# Altium project Phaser.PrjPCB (part 4 of 11)

## Sheet FPGA.SchDoc: =DocumentName
size A4; DocumentNumber: 1; Revision: 0; SheetNumber: 15; SheetTotal: 30
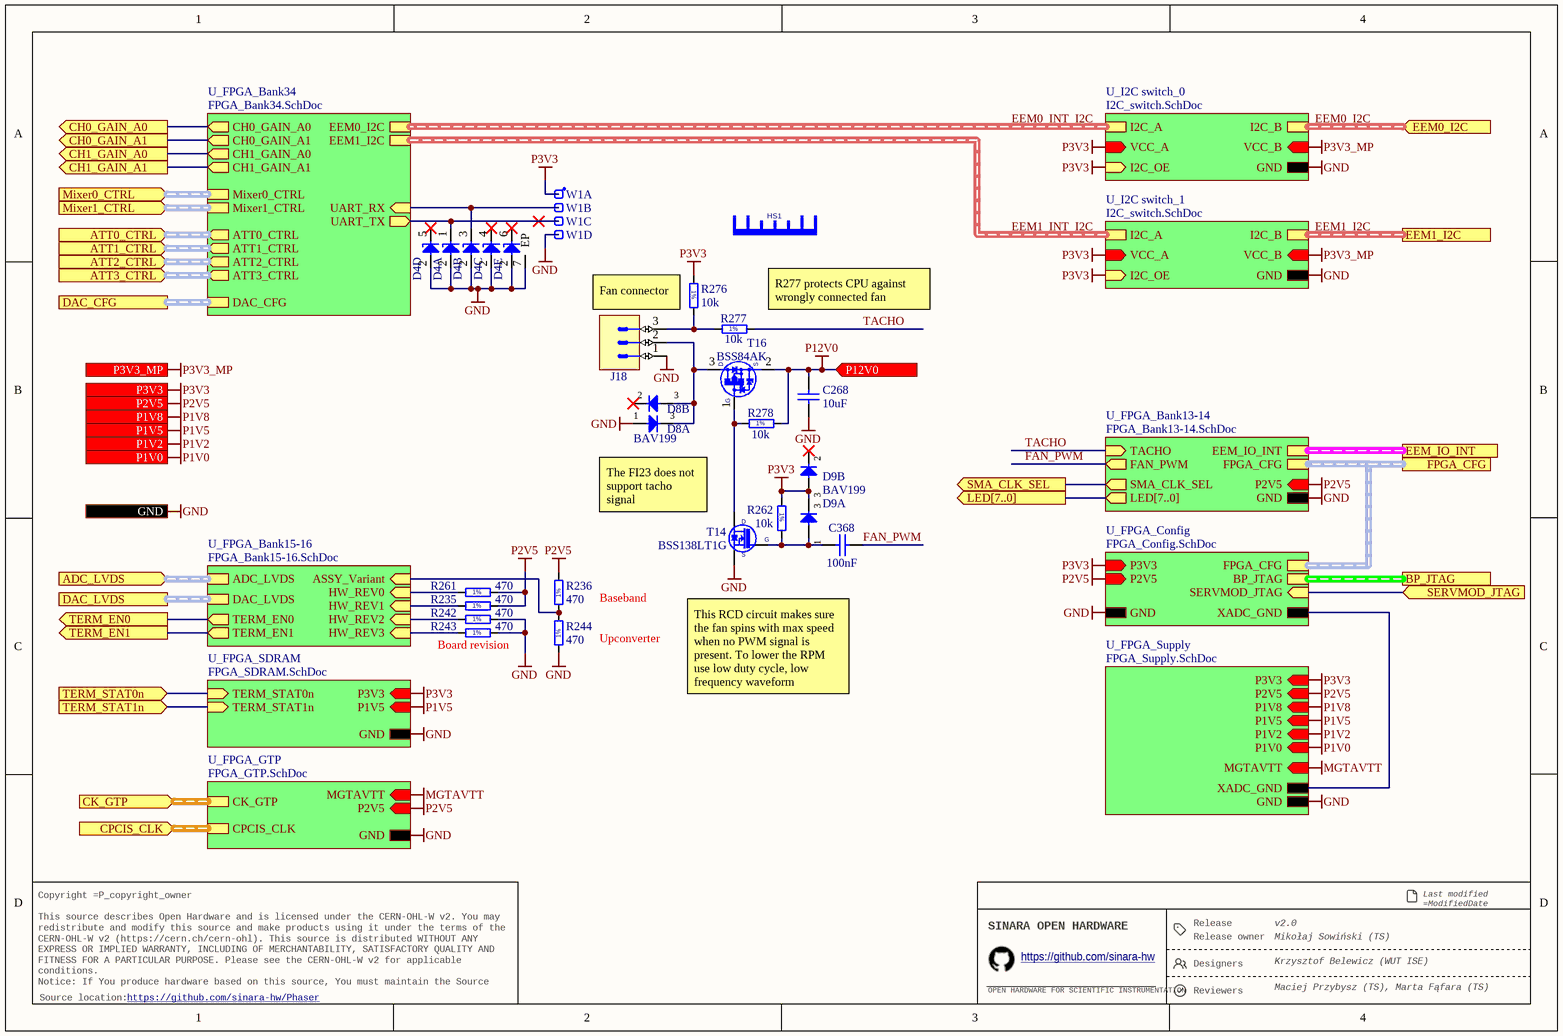
[diagram p11: FPGA.SchDoc]

### Parts
C268  10uF  [CAPC2012X95N]
C368  100nF  [CAPC0603X33N]
D4  UCLAMP3305P.TCT  [SON50P160X65_HS-7N]  (value not drawn)  (parts A,B,C,D,E of 5)
D8  BAV199  [SOT95P240X110-3N]  (parts A,B of 2)
D9  BAV199  [SOT95P240X110-3N]  (parts A,B of 2)
HS1  RADIAN_FI23  [RADIAN_FI23]  (value not drawn)
J18  KK®  [MOLEX_22-27-2031]  (value not drawn)
R235  470  [RESC1005X40N]
R236  470  [RESC1005X40N]
R242  470  [RESC1005X40N]
R243  470  [RESC1005X40N]
R244  470  [RESC1005X40N]
R261  470  [RESC1005X40N]
R262  10k  [RESC1005X40N]
R276  10k  [RESC1005X40N]
R277  10k  [RESC1005X40N]
R278  10k  [RESC1005X40N]
T14  BSS138LT1G  [SOT95P240X110-3N]
T16  BSS84AK  [SOT95P230X110-3N]
W1  Header 4  [SAMTEC_HTSW-104-23-L-S]  (value not drawn)  (parts A,B,C,D of 4)

### Sub-sheets
U_FPGA_Bank13-14 = FPGA_Bank13-14.SchDoc: GND, P2V5 (in), SMA_CLK_SEL (out), EEM_IO_INT (harness EEM_LVDS), FPGA_CFG (harness FPGA_CFG), TACHO (in), FAN_PWM (out), LED[7..0] (out)
U_FPGA_Bank15-16 = FPGA_Bank15-16.SchDoc: DAC_LVDS (harness DAC_LVDS), ADC_LVDS (harness ADC_LVDS), ASSY_Variant (in), HW_REV1 (in), HW_REV2 (in), HW_REV0 (in), HW_REV3 (in), TERM_EN0 (out), TERM_EN1 (out)
U_FPGA_Bank34 = FPGA_Bank34.SchDoc: CH0_GAIN_A0 (out), CH0_GAIN_A1 (out), CH1_GAIN_A0 (out), CH1_GAIN_A1 (out), Mixer1_CTRL (harness Mixer_CTRL), Mixer0_CTRL (harness Mixer_CTRL), ATT0_CTRL (out, harness ATT_CTRL), DAC_CFG (harness DAC_CFG), EEM1_I2C (harness I2C), EEM0_I2C (harness I2C), UART_RX (in), UART_TX (out), ATT1_CTRL (out, harness ATT_CTRL), ATT2_CTRL (out, harness ATT_CTRL), ATT3_CTRL (out, harness ATT_CTRL)
U_FPGA_Config = FPGA_Config.SchDoc: GND, XADC_GND, SERVMOD_JTAG (in), FPGA_CFG (harness FPGA_CFG), BP_JTAG (harness BP_JTAG), P3V3 (in), P2V5 (in)
U_FPGA_GTP = FPGA_GTP.SchDoc: GND, MGTAVTT (in), P2V5 (in), CK_GTP (harness CLK_DIFF), CPCIS_CLK (harness CLK_DIFF)
U_FPGA_SDRAM = FPGA_SDRAM.SchDoc: GND, P3V3 (in), P1V5 (in), TERM_STAT0n (in), TERM_STAT1n (in)
U_FPGA_Supply = FPGA_Supply.SchDoc: P3V3 (in), P1V8 (in), P1V5 (in), P2V5 (in), P1V2 (in), P1V0 (in), GND, MGTAVTT (in), XADC_GND
U_I2C switch_0 = I2C_switch.SchDoc: I2C_A (harness I2C), I2C_B (harness I2C), I2C_OE (in), GND, VCC_A (in), VCC_B (in)
U_I2C switch_1 = I2C_switch.SchDoc: I2C_A (harness I2C), I2C_B (harness I2C), I2C_OE (in), GND, VCC_A (in), VCC_B (in)

### Ports
ADC_LVDS (in, harness ADC_LVDS), ATT0_CTRL (in, harness ATT_CTRL), ATT1_CTRL (in, harness ATT_CTRL), ATT2_CTRL (in, harness ATT_CTRL), ATT3_CTRL (in, harness ATT_CTRL), BP_JTAG (harness BP_JTAG), CH0_GAIN_A0 (out), CH0_GAIN_A1 (out), CH1_GAIN_A0 (out), CH1_GAIN_A1 (out), CK_GTP (in, harness CLK_DIFF), CPCIS_CLK (in, harness CLK_DIFF), DAC_CFG (harness DAC_CFG), DAC_LVDS (harness DAC_LVDS), EEM0_I2C (in, harness I2C), EEM1_I2C (harness I2C), EEM_IO_INT (harness EEM_LVDS), FPGA_CFG (harness FPGA_CFG), GND, LED[7..0] (out), Mixer0_CTRL (in, harness Mixer_CTRL), Mixer1_CTRL (in, harness Mixer_CTRL), P1V0 (in), P1V2 (in), P1V5 (in), P1V8 (in), P2V5 (in), P3V3 (in), P3V3_MP (in), P12V0 (in), SERVMOD_JTAG (in), SMA_CLK_SEL (out), TERM_EN0 (out), TERM_EN1 (out), TERM_STAT0n (in), TERM_STAT1n (in)

### Nets
GND: C268.1 D4.2(A) D4.7(EP) D8.1(A) J18.1 R242.2 R243.2 R244.1 T14.2(S) W1.4 ; port GND, sheet U_FPGA_Bank13-14/GND, sheet U_FPGA_Supply/GND, sheet U_FPGA_Config/GND, sheet U_FPGA_SDRAM/GND, sheet U_FPGA_GTP/GND, sheet U_I2C switch_0/GND, sheet U_I2C switch_1/GND
MGTAVTT: sheet U_FPGA_Supply/MGTAVTT, sheet U_FPGA_GTP/MGTAVTT
P1V0: port P1V0, sheet U_FPGA_Supply/P1V0
P1V2: port P1V2, sheet U_FPGA_Supply/P1V2
P1V5: port P1V5, sheet U_FPGA_Supply/P1V5, sheet U_FPGA_SDRAM/P1V5
P1V8: port P1V8, sheet U_FPGA_Supply/P1V8
P2V5: R235.2 R236.2 R261.2 ; port P2V5, sheet U_FPGA_Bank13-14/P2V5, sheet U_FPGA_Supply/P2V5, sheet U_FPGA_Config/P2V5, sheet U_FPGA_GTP/P2V5
P3V3: D9.3(COMAC) R262.1 R276.1 W1.1 ; port P3V3, sheet U_FPGA_Supply/P3V3, sheet U_FPGA_Config/P3V3, sheet U_FPGA_SDRAM/P3V3, sheet U_I2C switch_0/I2C_OE, sheet U_I2C switch_0/VCC_A, sheet U_I2C switch_1/I2C_OE, sheet U_I2C switch_1/VCC_A
P3V3_MP: port P3V3_MP, sheet U_I2C switch_0/VCC_B, sheet U_I2C switch_1/VCC_B
P12V0: C268.2 R278.1 T16.2(S) ; port P12V0
ASSY_Variant: R236.1 R244.2 ; sheet U_FPGA_Bank15-16/ASSY_Variant
CH0_GAIN_A0: port CH0_GAIN_A0, sheet U_FPGA_Bank34/CH0_GAIN_A0
CH0_GAIN_A1: port CH0_GAIN_A1, sheet U_FPGA_Bank34/CH0_GAIN_A1
CH1_GAIN_A0: port CH1_GAIN_A0, sheet U_FPGA_Bank34/CH1_GAIN_A0
CH1_GAIN_A1: port CH1_GAIN_A1, sheet U_FPGA_Bank34/CH1_GAIN_A1
FAN_PWM: C368.2 ; sheet U_FPGA_Bank13-14/FAN_PWM
HW_REV0: R261.1 ; sheet U_FPGA_Bank15-16/HW_REV0
HW_REV1: R235.1 ; sheet U_FPGA_Bank15-16/HW_REV1
HW_REV2: R242.1 ; sheet U_FPGA_Bank15-16/HW_REV2
HW_REV3: R243.1 ; sheet U_FPGA_Bank15-16/HW_REV3
SERVMOD_JTAG: port SERVMOD_JTAG, sheet U_FPGA_Config/SERVMOD_JTAG
SMA_CLK_SEL: port SMA_CLK_SEL, sheet U_FPGA_Bank13-14/SMA_CLK_SEL
TACHO: R277.2 ; sheet U_FPGA_Bank13-14/TACHO
TERM_EN0: port TERM_EN0, sheet U_FPGA_Bank15-16/TERM_EN0
TERM_EN1: port TERM_EN1, sheet U_FPGA_Bank15-16/TERM_EN1
TERM_STAT0n: port TERM_STAT0n, sheet U_FPGA_SDRAM/TERM_STAT0n
TERM_STAT1n: port TERM_STAT1n, sheet U_FPGA_SDRAM/TERM_STAT1n
UART_RX: D4.3(C) W1.2 ; sheet U_FPGA_Bank34/UART_RX
UART_TX: D4.1(C) W1.3 ; sheet U_FPGA_Bank34/UART_TX
XADC_GND: sheet U_FPGA_Supply/XADC_GND, sheet U_FPGA_Config/XADC_GND
NetC368_1: C368.1 D9.1(A) R262.2 T14.1(G)
NetD8_3: D8.3(COMAC) J18.2 T16.3(D)
NetJ18_3: J18.3 R276.2 R277.1
NetR278_2: R278.2 T14.3(D) T16.1(G)

Not connected (* = marked no-connect by the designer): D4 4(C)* 5(C)* 6(C)*; D8 2(C)*; D9 2(C)*

### Buses and harness runs
bus port LED[7..0] = sheet U_FPGA_Bank13-14/LED[7..0]
harness EEM0_I2C = port EEM0_I2C = sheet U_I2C switch_0/I2C_B
harness EEM0_INT_I2C = sheet U_FPGA_Bank34/EEM0_I2C = sheet U_I2C switch_0/I2C_A
harness EEM1_I2C = port EEM1_I2C = sheet U_I2C switch_1/I2C_B
harness EEM1_INT_I2C = sheet U_FPGA_Bank34/EEM1_I2C = sheet U_I2C switch_1/I2C_A
harness port ADC_LVDS = sheet U_FPGA_Bank15-16/ADC_LVDS
harness port ATT0_CTRL = sheet U_FPGA_Bank34/ATT0_CTRL
harness port ATT1_CTRL = sheet U_FPGA_Bank34/ATT1_CTRL
harness port ATT2_CTRL = sheet U_FPGA_Bank34/ATT2_CTRL
harness port ATT3_CTRL = sheet U_FPGA_Bank34/ATT3_CTRL
harness port BP_JTAG = sheet U_FPGA_Config/BP_JTAG
harness port CK_GTP = sheet U_FPGA_GTP/CK_GTP
harness port CPCIS_CLK = sheet U_FPGA_GTP/CPCIS_CLK
harness port DAC_CFG = sheet U_FPGA_Bank34/DAC_CFG
harness port DAC_LVDS = sheet U_FPGA_Bank15-16/DAC_LVDS
harness port EEM_IO_INT = sheet U_FPGA_Bank13-14/EEM_IO_INT
harness port FPGA_CFG = sheet U_FPGA_Bank13-14/FPGA_CFG = sheet U_FPGA_Config/FPGA_CFG
harness port Mixer0_CTRL = sheet U_FPGA_Bank34/Mixer0_CTRL
harness port Mixer1_CTRL = sheet U_FPGA_Bank34/Mixer1_CTRL

### Notes on the sheet
- Fan connector
- R277 protects CPU against wrongly connected fan
- The FI23 does not support tacho signal
- (near R243) Board revision
- Baseband
- Upconverter
- This RCD circuit makes sure the fan spins with max speed when no PWM signal is present. To lower the RPM use low duty cycle, low frequency waveform
- Release
- Last modified =ModifiedDate
  Sheet =sheetnumber of =sheettotal · Size A4
- Copyright =P_copyright_owner
  This source describes Open Hardware and is licensed under the CERN-OHL-W v2. You may redistribute and modify this source and make products using it under the terms of the CERN-OHL-W v2 (https://cern.ch/cern-ohl). This source is distributed WITHOUT ANY EXPRESS OR IMPLIED WARRANTY, INCLUDING OF MERCHANTABILITY, SATISFACTORY QUALITY AND FITNESS FOR A PARTICULAR PURPOSE. Please see the CERN-OHL-W v2 for applicable conditions.
  Notice: If You produce hardware based on this source, You must maintain the Source Location visible on the product, its packaging or its documentation.
- SINARA OPEN HARDWARE
- OPEN HARDWARE FOR SCIENTIFIC INSTRUMENTATION
- https://github.com/sinara-hw
- Release owner
- Designers
- Reviewers
- Source location:
- (in symbol R0402_10K_1%_0.0625W_100PPM) 1%
- (in symbol R0402_470R_1%_0.0625W_100PPM) 1%

### Library data of the parts
C268 = CC0805_10UF_25V_10%_X5R: as C179 on sheet Power_AFE_DCDC; Part Number: CC0805_10UF_25V_10%_X5R; Component Kind: Standard; Component Type: Standard; Pin Count: 2; Value: 10uF; Status: Preferred; Manufacturer Part Number: CC0805_10UF_25V_10%_X5R; Case: 0805; Mounted: Yes; Socket: No; SMD: Yes; Sense: No; Manufacturer1 Example: MURATA; Manufacturer1 ComponentHeight: 0.95mm; HelpURL: \\cern.ch\dfs\Applications\Altium\Datasheets\CC0805_X5R_MURATA_GRM.pdf; Author: CERN DEM JLC; CreateDate: 25.10.2012; LatestRevisionDate: 06.09.2016
C368 = CC0201_100NF_6.3V_10%_X5R: Non-polarised capacitor; Part Description: SMD Multilayer Chip Ceramic Capacitor; Manufacturer: GENERIC; Manufacturer1 Part Number: 02016D104KAT2A; Voltage: 6.3V; TC: X5R; Tolerance: ±10%; Part Number: CC0201_100NF_6.3V_10%_X5R; Component Kind: Standard; Component Type: Standard; Pin Count: 2; Value: 100nF; Status: Not Recommended; Manufacturer Part Number: CC0201_100NF_6.3V_10%_X5R; Case: 0201; Mounted: Yes; Socket: No; SMD: Yes; Sense: No; Manufacturer1 Example: AVX; Manufacturer1 ComponentHeight: 0.33mm; HelpURL: \\cern.ch\dfs\Applications\Altium\Datasheets\CC0201_X5R_AVX.pdf; Author: CERN DEM JLC; CreateDate: 2007-12-03; LatestRevisionDate: 2007-12-03; ClassName: FPGA_JTAG
D4 = CMP-004-00037-2: as T_D2 on sheet CPCIS_Connectors_P1_P6; Max Operating Temperature: 125°C; Min Operating Temperature: -55°C; Pins: 6; Mounting Technology: Surface Mount
D8 D9 = BAV199: Serial Diode; Part Description: Low-Leakage Double Diode; Manufacturer: NXP SEMICONDUCTORS; Voltage: 75V; Power: 250mW; PressFit: No; Bonding: No; Part Number: BAV199; Component Kind: Standard; Component Type: Standard; Device: BAV199; PackageDescription: SOT23 3-Leads, Pitch 0.95mm - Body 1.4x3mm, IPC Medium Density; Manufacturer Part Number: BAV199; Pin Count: 3; Case: SOT23-3; Mounted: Yes; Socket: No; SMD: Yes; Sense: No; ComponentHeight: 1.1mm; HelpURL: \\cern.ch\dfs\Applications\Altium\Datasheets\BAV199.pdf; Author: CERN DEM JMW; CreateDate: 2008-11-21; LatestRevisionDate: 2008-11-21
HS1 = RADIAN_FI23: Heat Sink Without Pad; Manufacturer: Radian Thermal Products, Inc.; Manufacturer Part Number: FI23+BU+T725; Part Description: 23 x 23 x 16 mm, clip on heatsink with fan for IC design BGA and others; ComponentHeight: 16 mm; HelpURL: https://www.radianheatsinks.com/product/fi23/
J18 = MOLEX_22-27-2031: Connector 3 Male; Part Description: 2.54mm (.100") Pitch KK® Wire-to-Board Header, Vertical, with Friction Lock, 3 Circuits, Tin (Sn) Plating; Manufacturer: MOLEX; PressFit: No; Part Number: MOLEX_22-27-2031; Component Kind: Standard; Component Type: Standard; Pin Count: 3; Family: KK®; Mounted: Yes; Socket: No; SMD: No; Sense: No; Status: None; Manufacturer Part Number: 22-27-2031; ComponentHeight: 11.7mm; HelpURL: \\cern.ch\dfs\Applications\Altium\Datasheets\MOLEX_22-27-2031.pdf; Author: CERN DEM JLC; CreateDate: 04.12.2008; LatestRevisionDate: 04.12.2008
R235 R236 R242-R244 R261 = R0402_470R_1%_0.0625W_100PPM: Resistor - 1%; Part Description: General Purpose Thick Film Chip Resistor; Manufacturer: GENERIC; Manufacturer1 Part Number: 232270674701L; TC: ±100ppm/°C; PressFit: No; Part Number: R0402_470R_1%_0.0625W_100PPM; Component Kind: Standard; Component Type: Standard; Pin Count: 2; Value: 470; Status: Not Recommended; Power: 0.0625W; Tolerance: ±1%; Manufacturer Part Number: R0402_470R_1%_0.0625W_100PPM; Case: 0402; Mounted: Yes; Sense: No; Socket: No; SMD: Yes; Manufacturer1 Example: YAGEO PHYCOMP; Manufacturer1 ComponentHeight: 0.4mm; HelpURL: \\cern.ch\dfs\Applications\Altium\Datasheets\R0402_Phycomp_RC0402.pdf; Author: CERN DEM JLC; CreateDate: 03.12.2007; LatestRevisionDate: 17.10.2012
R262 = R0402_10K_1%_0.0625W_100PPM: Resistor - 1%; Part Description: General Purpose Thick Film Chip Resistor; Manufacturer: GENERIC; Manufacturer1 Part Number: 232270671003L; TC: ±100ppm/°C; Part Number: R0402_10K_1%_0.0625W_100PPM; Component Kind: Standard; Component Type: Standard; Pin Count: 2; Value: 10k; Status: Not recommended; Power: 0.0625W; Tolerance: ±1%; Manufacturer Part Number: R0402_10K_1%_0.0625W_100PPM; Case: 0402; Mounted: Yes; Sense: No; Socket: No; SMD: Yes; Manufacturer1 Example: YAGEO PHYCOMP; Manufacturer1 ComponentHeight: 0.4mm; HelpURL: \\cern.ch\dfs\Applications\Altium\Datasheets\R0402_Phycomp_RC0402.pdf; Author: CERN DEM JLC; CreateDate: 03.12.2007; LatestRevisionDate: 17.10.2012
R276-R278 = R0402_10K_1%_0.0625W_100PPM: Resistor - 1%; Part Description: General Purpose Thick Film Chip Resistor; Manufacturer: GENERIC; Manufacturer1 Part Number: 232270671003L; TC: ±100ppm/°C; PressFit: No; Part Number: R0402_10K_1%_0.0625W_100PPM; Component Kind: Standard; Component Type: Standard; Pin Count: 2; Value: 10k; Status: Not Recommended; Power: 0.0625W; Tolerance: ±1%; Manufacturer Part Number: R0402_10K_1%_0.0625W_100PPM; Case: 0402; Mounted: Yes; Sense: No; Socket: No; SMD: Yes; Manufacturer1 Example: YAGEO PHYCOMP; Manufacturer1 ComponentHeight: 0.4mm; HelpURL: \\cern.ch\dfs\Applications\Altium\Datasheets\R0402_Phycomp_RC0402.pdf; Author: CERN DEM JLC; CreateDate: 03.12.2007; LatestRevisionDate: 17.10.2012
T14 = BSS138LT1G: N-CHANNEL MOSFET WITH DIODE; Part Description: 50V 200mA N-Channel Enhancement Mode Field-Effect Transistor; Manufacturer: ON SEMICONDUCTOR; PressFit: No; Bonding: No; Part Number: BSS138LT1G; Component Kind: Standard; Component Type: Standard; Device: BSS138LT1G; PackageDescription: SOT23, 0.95mm Pitch; 3 Pin, 1.40mm W X 3.00mm L X 1.10mm H body, IPC Medium Density; Manufacturer Part Number: BSS138LT1G; Pin Count: 3; Case: SOT23-3; Mounted: Yes; Socket: No; SMD: Yes; Sense: No; ComponentHeight: 1.11mm; HelpURL: \\cern.ch\dfs\Applications\Altium\Datasheets\BSS138LT1G.pdf; Author: CERN DEM JLC; CreateDate: 23.03.2009; LatestRevisionDate: 23.03.2009
T16 = BSS84AK: 50V, 180mA P-Channel Trench MOSFET; Part Description: 50V, 180mA P-channel Trench MOSFET Transistor; Manufacturer: NXP SEMICONDUCTORS; PressFit: No; Bonding: No; Part Number: BSS84AK; Component Kind: Standard; Component Type: Standard; Device: BSS84AK; PackageDescription: SOT23, 0.95mm Pitch; 3 Pin, 1.30mm W X 2.90mm L X 1.10mm H body, IPC Medium Density; Manufacturer Part Number: BSS84AK; Pin Count: 3; Case: SOT23-3; Mounted: Yes; Socket: No; SMD: Yes; Sense: No; ComponentHeight: 1.1mm; HelpURL: \\cern.ch\dfs\Applications\Altium\Datasheets\BSS84AK.pdf; Author: CERN DEM JLC; CreateDate: 16.04.2015; LatestRevisionDate: 16.04.2015
W1 = SAMTEC_HTSW-104-23-L-S: 4 Mini Wire-Wrap Contact Strip Header; Part Description: 4 Contacts, Pitch 2.54mm, Single Row  Through Mount Straight Header (Post Lead 5.84mm, Tail Lead 2.92mm, Insulator 2.54mm); Manufacturer: SAMTEC; PressFit: No; Status Comment: High Temperature; Part Number: SAMTEC_HTSW-104-23-L-S; Component Kind: Standard; Component Type: Standard; Pin Count: 4; Family: Header 4; Mounted: Yes; Socket: No; Sense: No; SMD: No; Status: Preferred; Manufacturer Part Number: HTSW-104-23-L-S; ComponentHeight: 8.38mm; HelpURL: \\cern.ch\dfs\Applications\Altium\Datasheets\SAMTEC_HTSW-104-23-L-S.pdf; Author: CERN DEM JLC; CreateDate: 22/02/2018; LatestRevisionDate: 22/02/2018

## Sheet FPGA_Bank13-14.SchDoc: =DocumentName
size A3; DocumentNumber: 1; Revision: 0; SheetNumber: 19; SheetTotal: 30
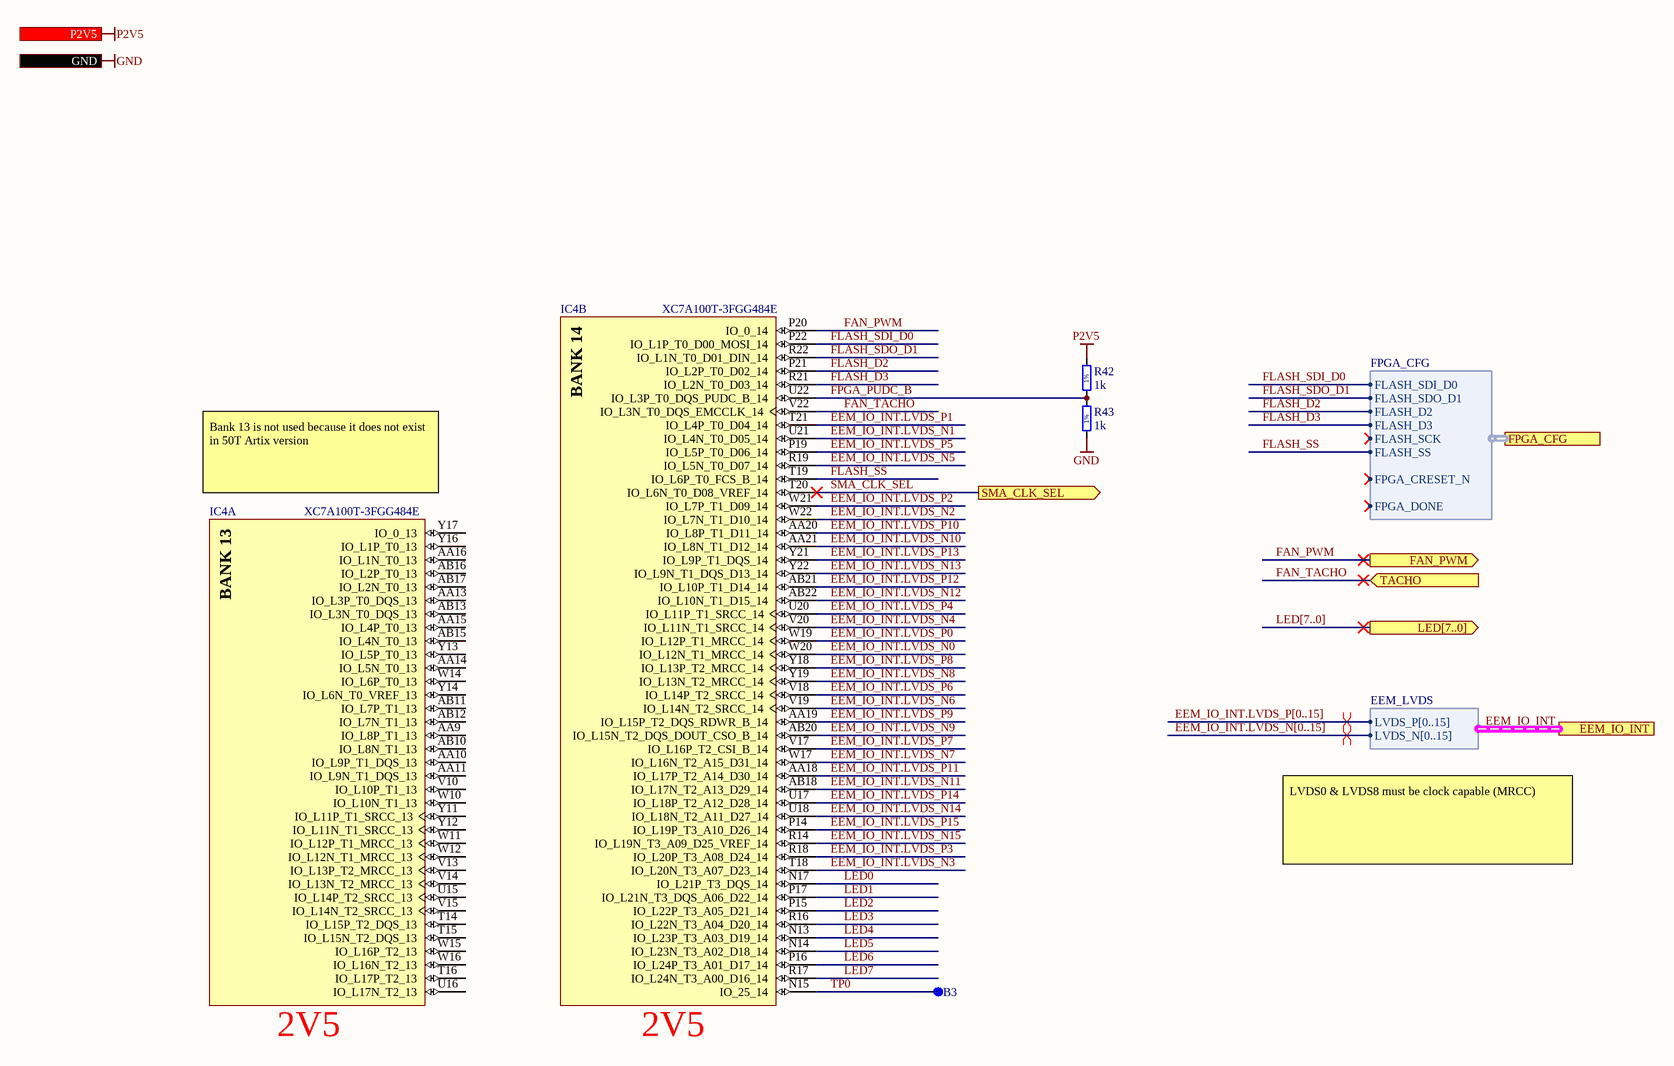
[diagram p12: FPGA_Bank13-14.SchDoc]

### Parts
(Parts that share a designator on the sheet are numbered #1, #2 ... from top to bottom, then left to right.)
B3  SMD Pad  [C100]  (value not drawn)
IC4#1  XC7A100T-3FGG484E  [FGG484]  (parts A,B of 10)
R42  1k  [RESC1005X40N]
R43  1k  [RESC1005X40N]

### Ports
EEM_IO_INT (harness EEM_LVDS), FAN_PWM (out), FPGA_CFG (harness FPGA_CFG), GND, LED[7..0] (out), P2V5 (in), SMA_CLK_SEL (out), TACHO (in)

### Harnesses
EEM_LVDS: LVDS_P[0..15], LVDS_N[0..15]
FPGA_CFG: FLASH_SDI_D0, FLASH_SDO_D1, FLASH_D2, FLASH_D3, FLASH_SCK, FLASH_SS, FPGA_CRESET_N, FPGA_DONE

### Nets
GND: R43.1 ; port GND
P2V5: R42.2 ; port P2V5
EEM_IO_INT.LVDS_N0: IC4#1.W20(IO_L12N_T1_MRCC_14)
EEM_IO_INT.LVDS_N1: IC4#1.U21(IO_L4N_T0_D05_14)
EEM_IO_INT.LVDS_N2: IC4#1.W22(IO_L7N_T1_D10_14)
EEM_IO_INT.LVDS_N3: IC4#1.T18(IO_L20N_T3_A07_D23_14)  [project net EEM_IO.LVDS_N3]
EEM_IO_INT.LVDS_N4: IC4#1.V20(IO_L11N_T1_SRCC_14)
EEM_IO_INT.LVDS_N5: IC4#1.R19(IO_L5N_T0_D07_14)  [project net EEM_IO.LVDS_N5]
EEM_IO_INT.LVDS_N6: IC4#1.V19(IO_L14N_T2_SRCC_14)  [project net EEM_IO.LVDS_N6]
EEM_IO_INT.LVDS_N7: IC4#1.W17(IO_L16N_T2_A15_D31_14)  [project net EEM_IO.LVDS_N7]
EEM_IO_INT.LVDS_N8: IC4#1.Y19(IO_L13N_T2_MRCC_14)  [project net EEM_IO.LVDS_N8]
EEM_IO_INT.LVDS_N9: IC4#1.AB20(IO_L15N_T2_DQS_DOUT_CSO_B_14)  [project net EEM_IO.LVDS_N9]
EEM_IO_INT.LVDS_N10: IC4#1.AA21(IO_L8N_T1_D12_14)  [project net EEM_IO.LVDS_N10]
EEM_IO_INT.LVDS_N11: IC4#1.AB18(IO_L17N_T2_A13_D29_14)  [project net EEM_IO.LVDS_N11]
EEM_IO_INT.LVDS_N12: IC4#1.AB22(IO_L10N_T1_D15_14)  [project net EEM_IO.LVDS_N12]
EEM_IO_INT.LVDS_N13: IC4#1.Y22(IO_L9N_T1_DQS_D13_14)  [project net EEM_IO.LVDS_N13]
EEM_IO_INT.LVDS_N14: IC4#1.U18(IO_L18N_T2_A11_D27_14)  [project net EEM_IO.LVDS_N14]
EEM_IO_INT.LVDS_N15: IC4#1.R14(IO_L19N_T3_A09_D25_VREF_14)  [project net EEM_IO.LVDS_N15]
EEM_IO_INT.LVDS_P0: IC4#1.W19(IO_L12P_T1_MRCC_14)
EEM_IO_INT.LVDS_P1: IC4#1.T21(IO_L4P_T0_D04_14)
EEM_IO_INT.LVDS_P2: IC4#1.W21(IO_L7P_T1_D09_14)
EEM_IO_INT.LVDS_P3: IC4#1.R18(IO_L20P_T3_A08_D24_14)  [project net EEM_IO.LVDS_P3]
EEM_IO_INT.LVDS_P4: IC4#1.U20(IO_L11P_T1_SRCC_14)
EEM_IO_INT.LVDS_P5: IC4#1.P19(IO_L5P_T0_D06_14)  [project net EEM_IO.LVDS_P5]
EEM_IO_INT.LVDS_P6: IC4#1.V18(IO_L14P_T2_SRCC_14)  [project net EEM_IO.LVDS_P6]
EEM_IO_INT.LVDS_P7: IC4#1.V17(IO_L16P_T2_CSI_B_14)  [project net EEM_IO.LVDS_P7]
EEM_IO_INT.LVDS_P8: IC4#1.Y18(IO_L13P_T2_MRCC_14)  [project net EEM_IO.LVDS_P8]
EEM_IO_INT.LVDS_P9: IC4#1.AA19(IO_L15P_T2_DQS_RDWR_B_14)  [project net EEM_IO.LVDS_P9]
EEM_IO_INT.LVDS_P10: IC4#1.AA20(IO_L8P_T1_D11_14)  [project net EEM_IO.LVDS_P10]
EEM_IO_INT.LVDS_P11: IC4#1.AA18(IO_L17P_T2_A14_D30_14)  [project net EEM_IO.LVDS_P11]
EEM_IO_INT.LVDS_P12: IC4#1.AB21(IO_L10P_T1_D14_14)  [project net EEM_IO.LVDS_P12]
EEM_IO_INT.LVDS_P13: IC4#1.Y21(IO_L9P_T1_DQS_14)  [project net EEM_IO.LVDS_P13]
EEM_IO_INT.LVDS_P14: IC4#1.U17(IO_L18P_T2_A12_D28_14)  [project net EEM_IO.LVDS_P14]
EEM_IO_INT.LVDS_P15: IC4#1.P14(IO_L19P_T3_A10_D26_14)  [project net EEM_IO.LVDS_P15]
FAN_PWM: IC4#1.P20(IO_0_14) ; port FAN_PWM
FAN_TACHO: IC4#1.V22(IO_L3N_T0_DQS_EMCCLK_14) ; port TACHO  [project net TACHO]
FLASH_D2: IC4#1.P21(IO_L2P_T0_D02_14) ; port FPGA_CFG.FLASH_D2  [project net FPGA_CFG.FLASH_D2]
FLASH_D3: IC4#1.R21(IO_L2N_T0_D03_14) ; port FPGA_CFG.FLASH_D3  [project net FPGA_CFG.FLASH_D3]
FLASH_SDI_D0: IC4#1.P22(IO_L1P_T0_D00_MOSI_14) ; port FPGA_CFG.FLASH_SDI_D0  [project net FPGA_CFG.FLASH_SDI_D0]
FLASH_SDO_D1: IC4#1.R22(IO_L1N_T0_D01_DIN_14) ; port FPGA_CFG.FLASH_SDO_D1  [project net FPGA_CFG.FLASH_SDO_D1]
FLASH_SS: IC4#1.T19(IO_L6P_T0_FCS_B_14) ; port FPGA_CFG.FLASH_SS  [project net FPGA_CFG.FLASH_SS]
FPGA_PUDC_B: IC4#1.U22(IO_L3P_T0_DQS_PUDC_B_14) R42.1 R43.2
LED0: IC4#1.N17(IO_L21P_T3_DQS_14)
LED1: IC4#1.P17(IO_L21N_T3_DQS_A06_D22_14)
LED2: IC4#1.P15(IO_L22P_T3_A05_D21_14)
LED3: IC4#1.R16(IO_L22N_T3_A04_D20_14)
LED4: IC4#1.N13(IO_L23P_T3_A03_D19_14)
LED5: IC4#1.N14(IO_L23N_T3_A02_D18_14)
LED6: IC4#1.P16(IO_L24P_T3_A01_D17_14)
LED7: IC4#1.R17(IO_L24N_T3_A00_D16_14)
SMA_CLK_SEL: IC4#1.T20(IO_L6N_T0_D08_VREF_14) ; port SMA_CLK_SEL
TP0: B3.1 IC4#1.N15(IO_25_14)

Not connected (* = marked no-connect by the designer): IC4#1 AA9(IO_L8P_T1_13) AA10(IO_L9P_T1_DQS_13) AA11(IO_L9N_T1_DQS_13) AA13(IO_L3P_T0_DQS_13) AA14(IO_L5N_T0_13) AA15(IO_L4P_T0_13) AA16(IO_L1N_T0_13) AB10(IO_L8N_T1_13) AB11(IO_L7P_T1_13) AB12(IO_L7N_T1_13) AB13(IO_L3N_T0_DQS_13) AB15(IO_L4N_T0_13) AB16(IO_L2P_T0_13) AB17(IO_L2N_T0_13) T14(IO_L15P_T2_DQS_13) T15(IO_L15N_T2_DQS_13) T16(IO_L17P_T2_13) U15(IO_L14P_T2_SRCC_13) U16(IO_L17N_T2_13) V10(IO_L10P_T1_13) V13(IO_L13P_T2_MRCC_13) V14(IO_L13N_T2_MRCC_13) V15(IO_L14N_T2_SRCC_13) W10(IO_L10N_T1_13) W11(IO_L12P_T1_MRCC_13) W12(IO_L12N_T1_MRCC_13) W14(IO_L6P_T0_13) W15(IO_L16P_T2_13) W16(IO_L16N_T2_13) Y11(IO_L11P_T1_SRCC_13) Y12(IO_L11N_T1_SRCC_13) Y13(IO_L5P_T0_13) Y14(IO_L6N_T0_VREF_13) Y16(IO_L1P_T0_13) Y17(IO_0_13)

### Buses and harness runs
bus EEM_IO_INT.LVDS_N[0..15]
bus EEM_IO_INT.LVDS_P[0..15]
bus LED[7..0] = port LED[7..0]
harness EEM_IO_INT = port EEM_IO_INT

### Layout directives
differential pair; differential pair class Diff_100Ohm: (no net found under the mark)

### Notes on the sheet
- (near IC4#1) Bank 13 is not used because it does not exist in 50T Artix version
- LVDS0 & LVDS8 must be clock capable (MRCC)
- 2V5
- Release
- Last modified =ModifiedDate
  Sheet =sheetnumber of =sheettotal · Size A3
- Copyright =P_copyright_owner
  This source describes Open Hardware and is licensed under the CERN-OHL-W v2. You may redistribute and modify this source and make products using it under the terms of the CERN-OHL-W v2 (https://cern.ch/cern-ohl). This source is distributed WITHOUT ANY EXPRESS OR IMPLIED WARRANTY, INCLUDING OF MERCHANTABILITY, SATISFACTORY QUALITY AND FITNESS FOR A PARTICULAR PURPOSE. Please see the CERN-OHL-W v2 for applicable conditions.
  Notice: If You produce hardware based on this source, You must maintain the Source Location visible on the product, its packaging or its documentation.
- SINARA OPEN HARDWARE
- OPEN HARDWARE FOR SCIENTIFIC INSTRUMENTATION
- https://github.com/sinara-hw
- Release owner
- Designers
- Reviewers
- Source location:
- (in symbol CMP-0364-00028-3, part A) BANK 13
- (in symbol CMP-0364-00028-3, part B) BANK 14
- (in symbol R0402_1K_1%_0.0625W_100PPM) 1%

### Library data of the parts
B3 = SMD_PAD_D1MM: Through Hole Pad; Part Description: 1mm Diameter SMD Pad; Mounted: No; Part Number: SMD_PAD_D1MM; Component Kind: Standard (No BOM); Component Type: Standard (No BOM); Pin Count: 1; Family: SMD Pad; Socket: No; SMD: No; Sense: No; Status: None; ComponentHeight: 0mm; HelpURL: Undefined; Author: CERN DEM JLC; CreateDate: 10.10.2017; LatestRevisionDate: 10.10.2017; PackageDescription: 1mm Diameter SMD Pad
IC4#1 = CMP-0364-00028-3: Artix-7 FPGA, 285 User I/Os, 4 GTP, 484-Ball BGA, Speed Grade 3, Extended Grade, Pb-Free; Manufacturer: Xilinx; Max User I/O: 300; Clock Mgmt Tiles (CMTs): 6; Logic Cells: 101440; Block RAM Blocks (36Kb): 135; Block RAM Blocks (18Kb): 270; Speed Grade: -3; CLBs (Slices): 15850; Block RAM Blocks (Max Kb): 4860; DSP48E1 Slices: 240; RoHS: Pb-Free; ComponentLink3URL: http://www.xilinx.com/support/documentation/data_sheets/ds181_Artix_7_Data_Sheet.pdf; NexusDeviceID: XC7A100T-3FGG484E; DatasheetVersion: v1.12; Mounting Technology: Surface Mount; PackageDescription: Wire-Bond Fine-Pitch BGA, Body 23 x 23 mm, 1.0 mm Pitch; PackageReference: FGG484; ComponentLink2Description: Package Specification; Code_JEDEC: MS-034-AAJ-1; ComponentLink2URL: http://www.xilinx.com/support/documentation/user_guides/ug475_7Series_Pkg_Pinout.pdf; ComponentLink3Description: DC and Switching Characteristics; Generic Part Number: XC7A100T; ComponentLink4Description: Package File; ComponentLink4URL: http://www.xilinx.com/support/packagefiles/a7packages/xc7a100tfgg484pkg.txt; ComponentLink1URL: http://www.xilinx.com/support/documentation/data_sheets/ds180_7Series_Overview.pdf; PartNumber: XC7A100T-3FGG484E; ComponentLink5URL: http://www.xilinx.com/support/documentation/user_guides/ug475_7Series_Pkg_Pinout.pdf; PackageVersion: Rev 1.8; ComponentLink5Description: Packaging and Pinout; ComponentLink1Description: Datasheet; CLBs (Max Distributed RAM Kb): 1188
R42 R43 = R0402_1K_1%_0.0625W_100PPM: Resistor - 1%; Part Description: General Purpose Thick Film Chip Resistor; Manufacturer: GENERIC; Manufacturer1 Part Number: 232270671002L; TC: ±100ppm/°C; PressFit: No; Part Number: R0402_1K_1%_0.0625W_100PPM; Component Kind: Standard; Component Type: Standard; Pin Count: 2; Value: 1k; Status: Not Recommended; Power: 0.0625W; Tolerance: ±1%; Manufacturer Part Number: R0402_1K_1%_0.0625W_100PPM; Case: 0402; Mounted: Yes; Sense: No; Socket: No; SMD: Yes; Manufacturer1 Example: YAGEO PHYCOMP; Manufacturer1 ComponentHeight: 0.4mm; HelpURL: \\cern.ch\dfs\Applications\Altium\Datasheets\R0402_Phycomp_RC0402.pdf; Author: CERN DEM JLC; CreateDate: 03.12.2007; LatestRevisionDate: 17.10.2012; ClassName: Artix

## Sheet FPGA_Supply.SchDoc: =DocumentName
size A3; DocumentNumber: 1; Revision: 0; SheetNumber: 16; SheetTotal: 30
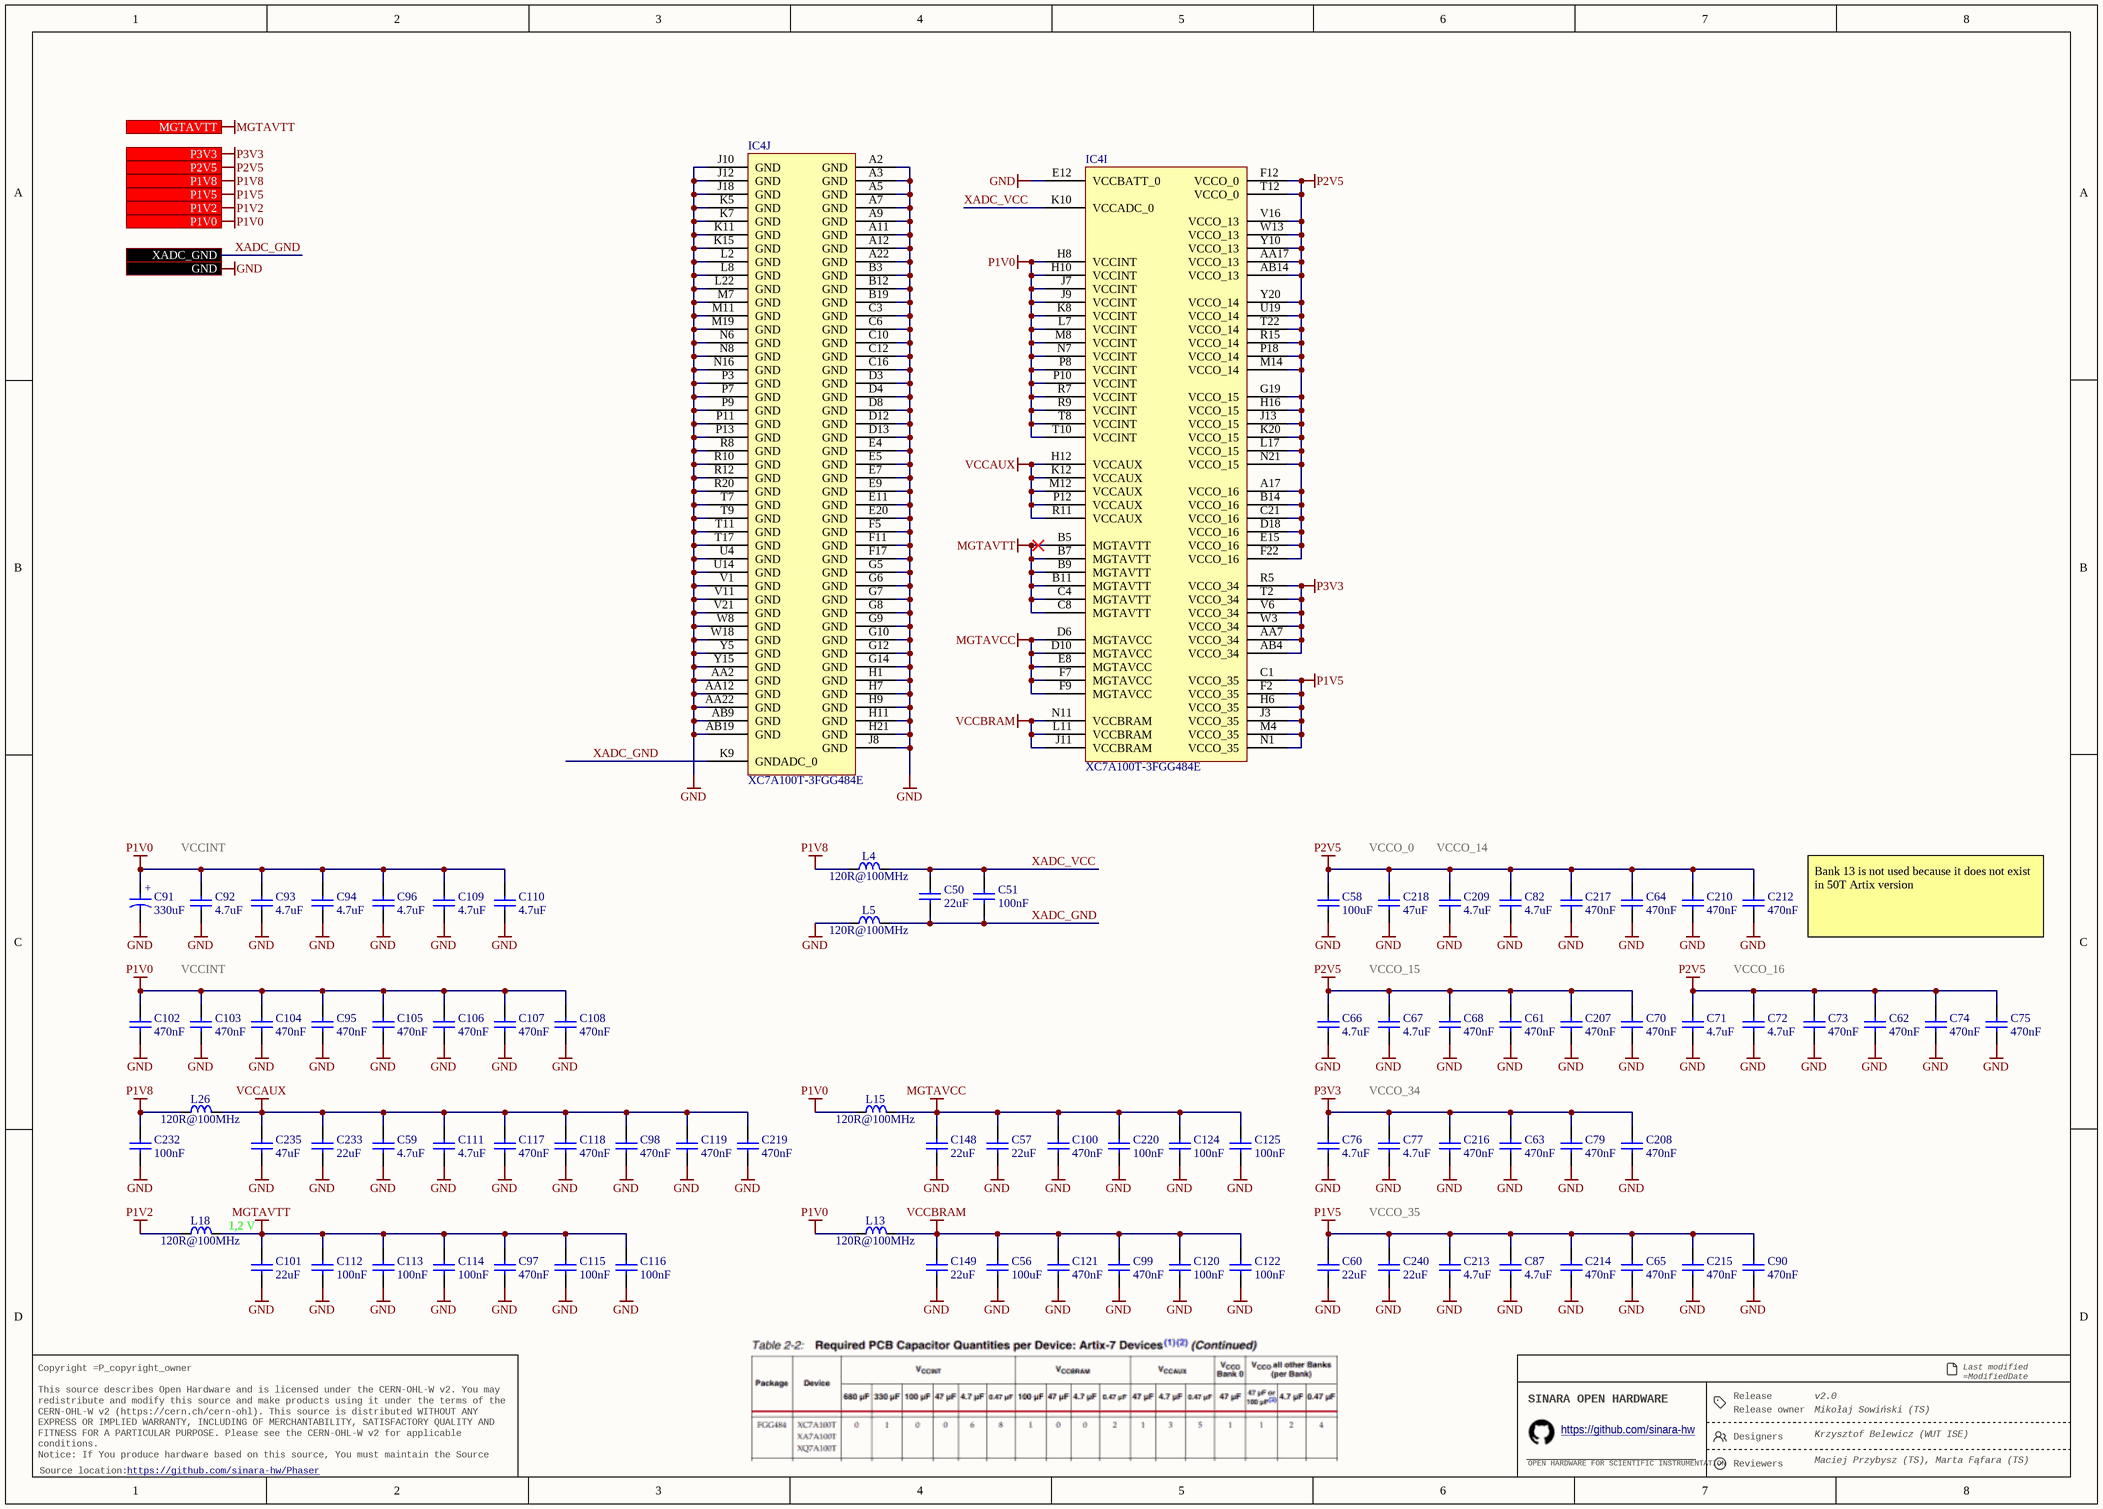
[diagram p13: FPGA_Supply.SchDoc]

### Parts
(Parts that share a designator on the sheet are numbered #1, #2 ... from top to bottom, then left to right.)
C50  22uF  [CAPC1709X100N]
C51  100nF  [CAPC0603X33N]
C56  100uF  [CAPC3225X270N]
C57  22uF  [CAPC1709X100N]
C58  100uF  [CAPC3225X270N]
C59  4.7uF  [CAPC2012X135N]
C60  22uF  [CAPC1709X100N]
C61  470nF  [CAPC0603X33N]
C62  470nF  [CAPC0603X33N]
C63  470nF  [CAPC0603X33N]
C64  470nF  [CAPC0603X33N]
C65  470nF  [CAPC0603X33N]
C66  4.7uF  [CAPC2012X135N]
C67  4.7uF  [CAPC2012X135N]
C68  470nF  [CAPC0603X33N]
C70  470nF  [CAPC0603X33N]
C71  4.7uF  [CAPC2012X135N]
C72  4.7uF  [CAPC2012X135N]
C73  470nF  [CAPC0603X33N]
C74  470nF  [CAPC0603X33N]
C75  470nF  [CAPC0603X33N]
C76  4.7uF  [CAPC2012X135N]
C77  4.7uF  [CAPC2012X135N]
C79  470nF  [CAPC0603X33N]
C82  4.7uF  [CAPC2012X135N]
C87  4.7uF  [CAPC2012X135N]
C90  470nF  [CAPC0603X33N]
C91  330uF  [CAPMP7343X190N]
C92  4.7uF  [CAPC2012X135N]
C93  4.7uF  [CAPC2012X135N]
C94  4.7uF  [CAPC2012X135N]
C95  470nF  [CAPC0603X33N]
C96  4.7uF  [CAPC2012X135N]
C97  470nF  [CAPC0603X33N]
C98  470nF  [CAPC0603X33N]
C99  470nF  [CAPC0603X33N]
C100  470nF  [CAPC0603X33N]
C101  22uF  [CAPC1709X100N]
C102  470nF  [CAPC0603X33N]
C103  470nF  [CAPC0603X33N]
C104  470nF  [CAPC0603X33N]
C105  470nF  [CAPC0603X33N]
C106  470nF  [CAPC0603X33N]
C107  470nF  [CAPC0603X33N]
C108  470nF  [CAPC0603X33N]
C109  4.7uF  [CAPC2012X135N]
C110  4.7uF  [CAPC2012X135N]
C111  4.7uF  [CAPC2012X135N]
C112  100nF  [CAPC0603X33N]
C113  100nF  [CAPC0603X33N]
C114  100nF  [CAPC0603X33N]
C115  100nF  [CAPC0603X33N]
C116  100nF  [CAPC0603X33N]
C117  470nF  [CAPC0603X33N]
C118  470nF  [CAPC0603X33N]
C119  470nF  [CAPC0603X33N]
C120  100nF  [CAPC0603X33N]
C121  470nF  [CAPC0603X33N]
C122  100nF  [CAPC0603X33N]
C124  100nF  [CAPC0603X33N]
C125  100nF  [CAPC0603X33N]
C148  22uF  [CAPC1709X100N]
C149  22uF  [CAPC1709X100N]
C207  470nF  [CAPC0603X33N]
C208  470nF  [CAPC0603X33N]
C209  4.7uF  [CAPC2012X135N]
C210  470nF  [CAPC0603X33N]
C212  470nF  [CAPC0603X33N]
C213  4.7uF  [CAPC2012X135N]
C214  470nF  [CAPC0603X33N]
C215  470nF  [CAPC0603X33N]
C216  470nF  [CAPC0603X33N]
C217  470nF  [CAPC0603X33N]
C218  47uF  [CAPC3225X270N]
C219  470nF  [CAPC0603X33N]
C220  100nF  [CAPC0603X33N]
C232  100nF  [CAPC0603X33N]
C233  22uF  [CAPC1709X100N]
C235  47uF  [CAPC3225X270N]
C240  22uF  [CAPC1709X100N]
IC4#1  XC7A100T-3FGG484E  [FGG484]  (parts I,J of 10)
L4  120R@100MHz  [INDC1608X65N]
L5  120R@100MHz  [INDC1608X65N]
L13  120R@100MHz  [INDC1608X65N]
L15  120R@100MHz  [INDC1608X65N]
L18  120R@100MHz  [INDC1608X65N]
L26  120R@100MHz  [INDC1608X65N]

### Ports
GND, MGTAVTT (in), P1V0 (in), P1V2 (in), P1V5 (in), P1V8 (in), P2V5 (in), P3V3 (in), XADC_GND

### Nets
GND: C56.1 C57.1 C58.1 C59.1 C60.1 C61.1 C62.1 C63.1 C64.1 C65.1 C66.1 C67.1 C68.1 C70.1 C71.1 C72.1 C73.1 C74.1 C75.1 C76.1 C77.1 C79.1 C82.1 C87.1 C90.1 C91.2 C92.1 C93.1 C94.1 C95.1 C96.1 C97.1 C98.1 C99.1 C100.1 C101.1 C102.1 C103.1 C104.1 C105.1 C106.1 C107.1 C108.1 C109.1 C110.1 C111.1 C112.1 C113.1 C114.1 C115.1 C116.1 C117.1 C118.1 C119.1 C120.1 C121.1 C122.1 C124.1 C125.1 C148.1 C149.1 C207.1 C208.1 C209.1 C210.1 C212.1 C213.1 C214.1 C215.1 C216.1 C217.1 C218.1 C219.1 C220.1 C232.1 C233.1 C235.1 C240.1 IC4#1.A2(GND) IC4#1.A3(GND) IC4#1.A5(GND) IC4#1.A7(GND) IC4#1.A9(GND) IC4#1.A11(GND) IC4#1.A12(GND) IC4#1.A22(GND) IC4#1.AA2(GND) IC4#1.AA12(GND) IC4#1.AA22(GND) IC4#1.AB9(GND) IC4#1.AB19(GND) IC4#1.B3(GND) IC4#1.B12(GND) IC4#1.B19(GND) IC4#1.C3(GND) IC4#1.C6(GND) IC4#1.C10(GND) IC4#1.C12(GND) IC4#1.C16(GND) IC4#1.D3(GND) IC4#1.D4(GND) IC4#1.D8(GND) IC4#1.D12(GND) IC4#1.D13(GND) IC4#1.E4(GND) IC4#1.E5(GND) IC4#1.E7(GND) IC4#1.E9(GND) IC4#1.E11(GND) IC4#1.E12(VCCBATT_0) IC4#1.E20(GND) IC4#1.F5(GND) IC4#1.F11(GND) IC4#1.F17(GND) IC4#1.G5(GND) IC4#1.G6(GND) IC4#1.G7(GND) IC4#1.G8(GND) IC4#1.G9(GND) IC4#1.G10(GND) IC4#1.G12(GND) IC4#1.G14(GND) IC4#1.H1(GND) IC4#1.H7(GND) IC4#1.H9(GND) IC4#1.H11(GND) IC4#1.H21(GND) IC4#1.J8(GND) IC4#1.J10(GND) IC4#1.J12(GND) IC4#1.J18(GND) IC4#1.K5(GND) IC4#1.K7(GND) IC4#1.K11(GND) IC4#1.K15(GND) IC4#1.L2(GND) IC4#1.L8(GND) IC4#1.L22(GND) IC4#1.M7(GND) IC4#1.M11(GND) IC4#1.M19(GND) IC4#1.N6(GND) IC4#1.N8(GND) IC4#1.N16(GND) IC4#1.P3(GND) IC4#1.P7(GND) IC4#1.P9(GND) IC4#1.P11(GND) IC4#1.P13(GND) IC4#1.R8(GND) IC4#1.R10(GND) IC4#1.R12(GND) IC4#1.R20(GND) IC4#1.T7(GND) IC4#1.T9(GND) IC4#1.T11(GND) IC4#1.T17(GND) IC4#1.U4(GND) IC4#1.U14(GND) IC4#1.V1(GND) IC4#1.V11(GND) IC4#1.V21(GND) IC4#1.W8(GND) IC4#1.W18(GND) IC4#1.Y5(GND) IC4#1.Y15(GND) L5.1 ; port GND
MGTAVCC: C57.2 C100.2 C124.2 C125.2 C148.2 C220.2 IC4#1.D6(MGTAVCC) IC4#1.D10(MGTAVCC) IC4#1.E8(MGTAVCC) IC4#1.F7(MGTAVCC) IC4#1.F9(MGTAVCC) L15.2
MGTAVTT: C97.2 C101.2 C112.2 C113.2 C114.2 C115.2 C116.2 IC4#1.B5(MGTAVTT) IC4#1.B7(MGTAVTT) IC4#1.B9(MGTAVTT) IC4#1.B11(MGTAVTT) IC4#1.C4(MGTAVTT) IC4#1.C8(MGTAVTT) L18.2 ; port MGTAVTT
P1V0: C91.1 C92.2 C93.2 C94.2 C95.2 C96.2 C102.2 C103.2 C104.2 C105.2 C106.2 C107.2 C108.2 C109.2 C110.2 IC4#1.H8(VCCINT) IC4#1.H10(VCCINT) IC4#1.J7(VCCINT) IC4#1.J9(VCCINT) IC4#1.K8(VCCINT) IC4#1.L7(VCCINT) IC4#1.M8(VCCINT) IC4#1.N7(VCCINT) IC4#1.P8(VCCINT) IC4#1.P10(VCCINT) IC4#1.R7(VCCINT) IC4#1.R9(VCCINT) IC4#1.T8(VCCINT) IC4#1.T10(VCCINT) L13.1 L15.1 ; port P1V0
P1V2: L18.1 ; port P1V2
P1V5: C60.2 C65.2 C87.2 C90.2 C213.2 C214.2 C215.2 C240.2 IC4#1.C1(VCCO_35) IC4#1.F2(VCCO_35) IC4#1.H6(VCCO_35) IC4#1.J3(VCCO_35) IC4#1.M4(VCCO_35) IC4#1.N1(VCCO_35) ; port P1V5
P1V8: C232.2 L4.1 L26.1 ; port P1V8
P2V5: C58.2 C61.2 C62.2 C64.2 C66.2 C67.2 C68.2 C70.2 C71.2 C72.2 C73.2 C74.2 C75.2 C82.2 C207.2 C209.2 C210.2 C212.2 C217.2 C218.2 IC4#1.A17(VCCO_16) IC4#1.AA17(VCCO_13) IC4#1.AB14(VCCO_13) IC4#1.B14(VCCO_16) IC4#1.C21(VCCO_16) IC4#1.D18(VCCO_16) IC4#1.E15(VCCO_16) IC4#1.F12(VCCO_0) IC4#1.F22(VCCO_16) IC4#1.G19(VCCO_15) IC4#1.H16(VCCO_15) IC4#1.J13(VCCO_15) IC4#1.K20(VCCO_15) IC4#1.L17(VCCO_15) IC4#1.M14(VCCO_14) IC4#1.N21(VCCO_15) IC4#1.P18(VCCO_14) IC4#1.R15(VCCO_14) IC4#1.T12(VCCO_0) IC4#1.T22(VCCO_14) IC4#1.U19(VCCO_14) IC4#1.V16(VCCO_13) IC4#1.W13(VCCO_13) IC4#1.Y10(VCCO_13) IC4#1.Y20(VCCO_14) ; port P2V5
P3V3: C63.2 C76.2 C77.2 C79.2 C208.2 C216.2 IC4#1.AA7(VCCO_34) IC4#1.AB4(VCCO_34) IC4#1.R5(VCCO_34) IC4#1.T2(VCCO_34) IC4#1.V6(VCCO_34) IC4#1.W3(VCCO_34) ; port P3V3
VCCAUX: C59.2 C98.2 C111.2 C117.2 C118.2 C119.2 C219.2 C233.2 C235.2 IC4#1.H12(VCCAUX) IC4#1.K12(VCCAUX) IC4#1.M12(VCCAUX) IC4#1.P12(VCCAUX) IC4#1.R11(VCCAUX) L26.2
VCCBRAM: C56.2 C99.2 C120.2 C121.2 C122.2 C149.2 IC4#1.J11(VCCBRAM) IC4#1.L11(VCCBRAM) IC4#1.N11(VCCBRAM) L13.2
XADC_GND: C50.1 C51.1 IC4#1.K9(GNDADC_0) L5.2 ; port XADC_GND
XADC_VCC: C50.2 C51.2 IC4#1.K10(VCCADC_0) L4.2

### Notes on the sheet
- VCCINT
- VCCO_0
- VCCO_14
- VCCO_15
- VCCO_16
- Bank 13 is not used because it does not exist in 50T Artix version
- VCCO_34
- 1,2 V
- VCCO_35
- Release
- Last modified =ModifiedDate
  Sheet =sheetnumber of =sheettotal · Size A3
- Copyright =P_copyright_owner
  This source describes Open Hardware and is licensed under the CERN-OHL-W v2. You may redistribute and modify this source and make products using it under the terms of the CERN-OHL-W v2 (https://cern.ch/cern-ohl). This source is distributed WITHOUT ANY EXPRESS OR IMPLIED WARRANTY, INCLUDING OF MERCHANTABILITY, SATISFACTORY QUALITY AND FITNESS FOR A PARTICULAR PURPOSE. Please see the CERN-OHL-W v2 for applicable conditions.
  Notice: If You produce hardware based on this source, You must maintain the Source Location visible on the product, its packaging or its documentation.
- SINARA OPEN HARDWARE
- OPEN HARDWARE FOR SCIENTIFIC INSTRUMENTATION
- https://github.com/sinara-hw
- Release owner
- Designers
- Reviewers
- Source location:
- (in symbol CTE7343-19_330UF_2.5V_20%_LESR0025_KEMET_T520) +

### Library data of the parts
C50 C57 C60 C101 C148 C149 C233 C240 = CC0603_22UF_6.3V_20%_X5R: Non-polarised capacitor; Part Description: SMD Multilayer Chip Ceramic Capacitor; Manufacturer: GENERIC; Manufacturer1 Part Number: C1608X5R0J226M080AC; Voltage: 6.3V; TC: X5R; Tolerance: ±20%; Part Number: CC0603_22UF_6.3V_20%_X5R; Component Kind: Standard; Component Type: Standard; Pin Count: 2; Value: 22uF; Status: None; Manufacturer Part Number: CC0603_22UF_6.3V_20%_X5R; Case: 0603; Mounted: Yes; Socket: No; SMD: Yes; Sense: No; Manufacturer1 Example: TDK; Manufacturer1 ComponentHeight: 1mm; HelpURL: \\cern.ch\dfs\Applications\Altium\Datasheets\CC0603_X5R_TDK_C.pdf; Author: CERN DEM JLC; CreateDate: 16.12.2013; LatestRevisionDate: 13.09.2016
  C50 C57 C60 C101 C240: ClassName: Artix
C51 C112-C116 C120 C122 C124 C125 C220 C232 = CC0201_100NF_6.3V_10%_X5R: as C368 on sheet FPGA; Part Number: CC0201_100NF_6.3V_10%_X5R; Component Kind: Standard; Component Type: Standard; Pin Count: 2; Value: 100nF; Status: Not Recommended; Manufacturer Part Number: CC0201_100NF_6.3V_10%_X5R; Case: 0201; Mounted: Yes; Socket: No; SMD: Yes; Sense: No; Manufacturer1 Example: AVX; Manufacturer1 ComponentHeight: 0.33mm; HelpURL: \\cern.ch\dfs\Applications\Altium\Datasheets\CC0201_X5R_AVX.pdf; Author: CERN DEM JLC
  C51 C112-C116 C120 C122 C124 C125 C220: CreateDate: 2007-12-03; LatestRevisionDate: 2007-12-03; ClassName: Artix
  C232: CreateDate: 03.12.2007; LatestRevisionDate: 03.12.2007
C56 C58 = CC1210_100UF_6.3V_20%_X5R: Non-polarised capacitor; Part Description: SMD Multilayer Chip Ceramic Capacitor; Manufacturer: GENERIC; Manufacturer1 Part Number: GRM32ER60J107ME20L; Voltage: 6.3V; TC: X5R; Tolerance: ±20%; Part Number: CC1210_100UF_6.3V_20%_X5R; Component Kind: Standard; Component Type: Standard; Pin Count: 2; Value: 100uF; Status: Preferred; Manufacturer Part Number: CC1210_100UF_6.3V_20%_X5R; Case: 1210; Mounted: Yes; Socket: No; SMD: Yes; Sense: No; Manufacturer1 Example: MURATA; Manufacturer1 ComponentHeight: 2.7mm; HelpURL: \\cern.ch\dfs\Applications\Altium\Datasheets\CC1210_X5R_MURATA.pdf; Author: CERN DEM JLC; CreateDate: 19.04.2010; LatestRevisionDate: 19.04.2010
C59 C66 C67 C71 C72 C76 C77 C82 C87 C92-C94 C96 C109-C111 C209 C213 = CC0805_4.7UF_16V_10%_X7R: Non-polarised capacitor; Part Description: SMD Multilayer Chip Ceramic Capacitor; Manufacturer: GENERIC; Manufacturer1 Part Number: EMK212B7475KG-T; Voltage: 16V; TC: X7R; Tolerance: ±10%; Part Number: CC0805_4.7UF_16V_10%_X7R; Component Kind: Standard; Component Type: Standard; Pin Count: 2; Value: 4.7uF; Status: Preferred; Manufacturer Part Number: CC0805_4.7UF_16V_10%_X7R; Case: 0805; Mounted: Yes; Socket: No; SMD: Yes; Sense: No; Manufacturer1 Example: TAIYO YUDEN; Manufacturer1 ComponentHeight: 1.35mm; HelpURL: \\cern.ch\dfs\Applications\Altium\Datasheets\CC0805_X7R_TAIYO-YUDEN_HIGH-VALUE.pdf; Author: CERN DEM JLC; CreateDate: 16.09.2014; LatestRevisionDate: 16.09.2014
C61-C65 C68 C70 C73-C75 C79 C90 C95 C97-C100 C102-C108 C117-C119 C121 C207 C208 C210 C212 C214-C217 C219 = CC0201_470NF_4V_20%_X5R: Non-polarised capacitor; Part Description: SMD Multilayer Chip Ceramic Capacitor; Manufacturer: GENERIC; Manufacturer1 Part Number: AMK063BJ474MP-F; Voltage: 4V; TC: X5R; Tolerance: ±20%; Part Number: CC0201_470NF_4V_20%_X5R; Component Kind: Standard; Component Type: Standard; Pin Count: 2; Value: 470nF; Status: Not Recommended; Manufacturer Part Number: CC0201_470NF_4V_20%_X5R; Case: 0201; Mounted: Yes; Socket: No; SMD: Yes; Sense: No; Manufacturer1 Example: TAIYO YUDEN; Manufacturer1 ComponentHeight: 0.33mm; HelpURL: \\cern.ch\dfs\Applications\Altium\Datasheets\CC0201_X5R_TAIYO-YUDEN_STANDARD-CLASS2.pdf; Author: CERN DEM JLC; CreateDate: 27.05.2010; LatestRevisionDate: 27.05.2010
  C61-C65 C95 C97-C100: ClassName: Artix
C91 = CTE7343-19_330UF_2.5V_20%_LESR0025_KEMET_T520: Polarised capacitor; Part Description: Low ESR 0R025 Tantalum Chip Capacitor; Manufacturer: KEMET; Manufacturer Part Number: T520V337M2R5ATE025; Voltage: 2.5V; Tolerance: ±20%; Part Number: CTE7343-19_330UF_2.5V_20%_LESR0025_KEMET_T520; Component Kind: Standard; Component Type: Standard; Pin Count: 2; Value: 330uF; Status: None; Case: V; Mounted: Yes; Socket: No; SMD: Yes; Sense: No; ComponentHeight: 1.9mm; HelpURL: \\cern.ch\dfs\Applications\Altium\Datasheets\CTE-LESR_KEMET_T520.pdf; Author: CERN DEM MR; CreateDate: 23.03.2016; LatestRevisionDate: 23.03.2016
C218 C235 = CC1210_47UF_10V_10%_X7R: Non-polarised capacitor; Part Description: SMD Multilayer Chip Ceramic Capacitor; Manufacturer: GENERIC; Manufacturer1 Part Number: GRM32ER71A476KE15; Voltage: 10V; TC: X7R; Tolerance: ±10%; Part Number: CC1210_47UF_10V_10%_X7R; Component Kind: Standard; Component Type: Standard; Pin Count: 2; Value: 47uF; Status: None; Manufacturer Part Number: CC1210_47UF_10V_10%_X7R; Case: 1210; Mounted: Yes; Socket: No; SMD: Yes; Sense: No; Manufacturer1 Example: MURATA; Manufacturer1 ComponentHeight: 2.7mm; HelpURL: \\cern.ch\dfs\Applications\Altium\Datasheets\CC1210_X7R_MURATA.pdf; Author: CERN DEM BC; CreateDate: 18.11.2015; LatestRevisionDate: 18.11.2015
IC4#1 = CMP-0364-00028-3: as IC4#1 on sheet FPGA_Bank13-14; RoHS: Pb-Free; ComponentLink3URL: http://www.xilinx.com/support/documentation/data_sheets/ds181_Artix_7_Data_Sheet.pdf; NexusDeviceID: XC7A100T-3FGG484E; DatasheetVersion: v1.12; Mounting Technology: Surface Mount; PackageDescription: Wire-Bond Fine-Pitch BGA, Body 23 x 23 mm, 1.0 mm Pitch; PackageReference: FGG484; ComponentLink2Description: Package Specification; Code_JEDEC: MS-034-AAJ-1; ComponentLink2URL: http://www.xilinx.com/support/documentation/user_guides/ug475_7Series_Pkg_Pinout.pdf; ComponentLink3Description: DC and Switching Characteristics; Generic Part Number: XC7A100T; ComponentLink4Description: Package File; ComponentLink4URL: http://www.xilinx.com/support/packagefiles/a7packages/xc7a100tfgg484pkg.txt; ComponentLink1URL: http://www.xilinx.com/support/documentation/data_sheets/ds180_7Series_Overview.pdf; PartNumber: XC7A100T-3FGG484E; ComponentLink5URL: http://www.xilinx.com/support/documentation/user_guides/ug475_7Series_Pkg_Pinout.pdf; PackageVersion: Rev 1.8; ComponentLink5Description: Packaging and Pinout; ComponentLink1Description: Datasheet; CLBs (Max Distributed RAM Kb): 1188
L4 L5 L13 L15 L18 L26 = IND0603_MURATA_BLM18SG121TN1D: Inductor; Part Description: SMD EMIFIL Suppression Chip Ferrite Bead; Manufacturer: MURATA; Power: 3A; Resistance: 0.025R; Tolerance: ±25%; Part Number: IND0603_MURATA_BLM18SG121TN1D; Component Kind: Standard; Component Type: Standard; Pin Count: 2; Value: 120R@100MHz; Status: None; Manufacturer Part Number: BLM18SG121TN1D; Case: 0603; Mounted: Yes; Socket: No; SMD: Yes; Sense: No; ComponentHeight: 0.65mm; HelpURL: \\cern.ch\dfs\Applications\Altium\Datasheets\IND0603_MURATA_BLM18S.pdf; Author: CERN DEM JLC; CreateDate: 23.07.2014; LatestRevisionDate: 23.07.2014
  L4 L5: ClassName: Artix